# Altium schematic sheet EL.SchDoc: Electronic Load
size A4; ApprovedBy: LD Stanton; Author: LD Stanton; CompanyName: University of Cape Town; DrawnBy: Lawrence Stanton; Engineer: Lawrence Stanton; Organization: University of Cape Town; Address1: Department of Electrical Engineering; Address2: Rondebosch; Address3: Cape Town; Address4: South Africa 7701; DocumentNumber: 13; SheetNumber: 13; SheetTotal: 14
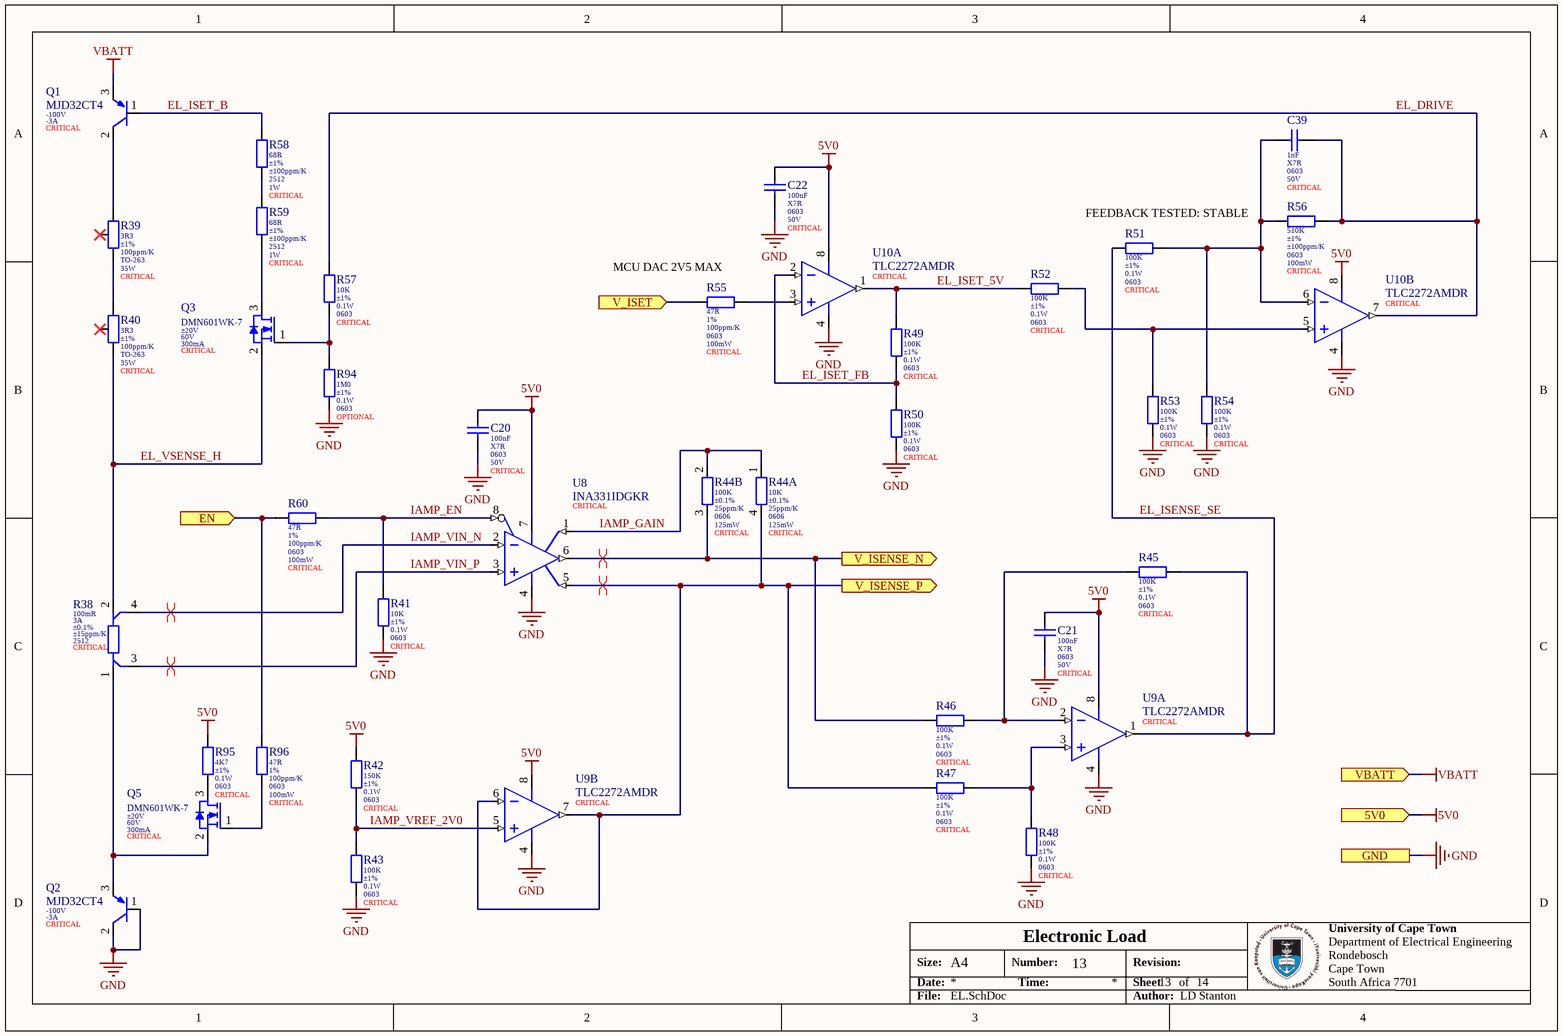
[diagram p0: EL.SchDoc]

## Parts
C20  value 100nF  Dielectric: X7R  Package: 0603  Voltage: 50V  Populate: CRITICAL  [0603 (Yageo DA) B]  (hidden comment: CC0603KRX7R9BB104)
C21  value 100nF  Dielectric: X7R  Package: 0603  Voltage: 50V  Populate: CRITICAL  [0603 (Yageo DA) B]  (hidden comment: CC0603KRX7R9BB104)
C22  value 100nF  Dielectric: X7R  Package: 0603  Voltage: 50V  Populate: CRITICAL  [0603 (Yageo DA) B]  (hidden comment: CC0603KRX7R9BB104)
C39  value 1nF  Dielectric: X7R  Package: 0603  Voltage: 50V  Populate: CRITICAL  [0603_080_8 (Samsung) B]  (hidden comment: CL10B102KB8NNNC)
Q1  MJD32CT4  Collector-Emitter Voltage: -100V  Collector Current: -3A  Placement: CRITICAL  [TO-252 (MJD32C) B]
Q2  MJD32CT4  Collector-Emitter Voltage: -100V  Collector Current: -3A  Placement: CRITICAL  [TO-252 (MJD32C) B]
Q3  DMN601WK-7  Gate Source Voltage: ±20V  Drain Source Voltage: 60V  Continous Drain Current: 300mA  Placement: CRITICAL  [SOT323 (DMN601WK) B]
Q5  DMN601WK-7  Gate Source Voltage: ±20V  Drain Source Voltage: 60V  Continous Drain Current: 300mA  Placement: CRITICAL  [SOT323 (DMN601WK) B]
R38  value 100mR  Current Rating: 3A  Tolerance: ±0.1%  Temperature Coefficient: ±15ppm/K  Package: 2512  Populate: CRITICAL  [2512 (Resi PCSR2512) MRG]  (hidden comment: PCSR2512BR100M6)
R39  value 3R3  Tolerance: ±1%  Temperature Coefficient: 100ppm/K  Package: TO-263  Power: 35W  Populate: CRITICAL  [TO-263 (TPAL0263) B]  (hidden comment: TPAL0263F3R30K9)
R40  value 3R3  Tolerance: ±1%  Temperature Coefficient: 100ppm/K  Package: TO-263  Power: 35W  Populate: CRITICAL  [TO-263 (TPAL0263) B]  (hidden comment: TPAL0263F3R30K9)
R41  value 10K  Tolerance: ±1%  Power: 0.1W  Package: 0603  Populate: CRITICAL  [0603 (Uniroyal) B]  (hidden comment: 0603WAF1002T5E)
R42  value 150K  Tolerance: ±1%  Power: 0.1W  Package: 0603  Populate: CRITICAL  [0603 (Uniroyal) B]  (hidden comment: 0603WAF1503T5E)
R43  value 100K  Tolerance: ±1%  Power: 0.1W  Package: 0603  Populate: CRITICAL  [0603 (Uniroyal) B]  (hidden comment: 0603WAF1003T5E)
R44  value 10K  Tolerance: ±0.1%  Temperature Coefficient: 25ppm/K  Package: 0606  Power: 125mW  Populate: CRITICAL  [0606 (Vishay ACASN) B]  (hidden comment: ACASN1002S1003P1AT)  (parts A,B of 2)
R45  value 100K  Tolerance: ±1%  Power: 0.1W  Package: 0603  Populate: CRITICAL  [0603 (Uniroyal) B]  (hidden comment: 0603WAF1003T5E)
R46  value 100K  Tolerance: ±1%  Power: 0.1W  Package: 0603  Populate: CRITICAL  [0603 (Uniroyal) B]  (hidden comment: 0603WAF1003T5E)
R47  value 100K  Tolerance: ±1%  Power: 0.1W  Package: 0603  Populate: CRITICAL  [0603 (Uniroyal) B]  (hidden comment: 0603WAF1003T5E)
R48  value 100K  Tolerance: ±1%  Power: 0.1W  Package: 0603  Populate: CRITICAL  [0603 (Uniroyal) B]  (hidden comment: 0603WAF1003T5E)
R49  value 100K  Tolerance: ±1%  Power: 0.1W  Package: 0603  Populate: CRITICAL  [0603 (Uniroyal) B]  (hidden comment: 0603WAF1003T5E)
R50  value 100K  Tolerance: ±1%  Power: 0.1W  Package: 0603  Populate: CRITICAL  [0603 (Uniroyal) B]  (hidden comment: 0603WAF1003T5E)
R51  value 100K  Tolerance: ±1%  Power: 0.1W  Package: 0603  Populate: CRITICAL  [0603 (Uniroyal) B]  (hidden comment: 0603WAF1003T5E)
R52  value 100K  Tolerance: ±1%  Power: 0.1W  Package: 0603  Populate: CRITICAL  [0603 (Uniroyal) B]  (hidden comment: 0603WAF1003T5E)
R53  value 100K  Tolerance: ±1%  Power: 0.1W  Package: 0603  Populate: CRITICAL  [0603 (Uniroyal) B]  (hidden comment: 0603WAF1003T5E)
R54  value 100K  Tolerance: ±1%  Power: 0.1W  Package: 0603  Populate: CRITICAL  [0603 (Uniroyal) B]  (hidden comment: 0603WAF1003T5E)
R55  value 47R  Tolerance: 1%  Temperature Coefficient: 100ppm/K  Package: 0603  Power: 100mW  Populate: CRITICAL  [0603 (Uniroyal) B]  (hidden comment: 0603WAF470JT5E)
R56  value 510K  Tolerance: ±1%  Temperature Coefficient: ±100ppm/K  Package: 0603  Power: 100mW  Populate: CRITICAL  [0603 (Uniroyal) B]  (hidden comment: 0603WAF5103T5E)
R57  value 10K  Tolerance: ±1%  Power: 0.1W  Package: 0603  Populate: CRITICAL  [0603 (Uniroyal) B]  (hidden comment: 0603WAF1002T5E)
R58  value 68R  Tolerance: ±1%  Temperature Coefficient: ±100ppm/K  Package: 2512  Power: 1W  Populate: CRITICAL  [2512 (Uniroyal) B]  (hidden comment: 25121WF680JT4E)
R59  value 68R  Tolerance: ±1%  Temperature Coefficient: ±100ppm/K  Package: 2512  Power: 1W  Populate: CRITICAL  [2512 (Uniroyal) B]  (hidden comment: 25121WF680JT4E)
R60  value 47R  Tolerance: 1%  Temperature Coefficient: 100ppm/K  Package: 0603  Power: 100mW  Populate: CRITICAL  [0603 (Uniroyal) B]  (hidden comment: 0603WAF470JT5E)
R94  value 1M0  Tolerance: ±1%  Power: 0.1W  Package: 0603  Populate: OPTIONAL  [0603 (Uniroyal) B]  (hidden comment: 0603WAF1004T5E)
R95  value 4K7  Tolerance: ±1%  Power: 0.1W  Package: 0603  Populate: CRITICAL  [0603 (Uniroyal) B]  (hidden comment: 0603WAF4701T5E)
R96  value 47R  Tolerance: 1%  Temperature Coefficient: 100ppm/K  Package: 0603  Power: 100mW  Populate: CRITICAL  [0603 (Uniroyal) B]  (hidden comment: 0603WAF470JT5E)
U8  INA331IDGKR  Placement: CRITICAL  [MSOP-8 (INA331) B]
U9  TLC2272AMDR  Placement: CRITICAL  [SOIC-8 (D008A) B]  (parts A,B of 2)
U10  TLC2272AMDR  Placement: CRITICAL  [SOIC-8 (D008A) B]  (parts A,B of 2)

## Ports
5V0 (in), EN (in), GND, V_ISENSE_N (out), V_ISENSE_P (out), V_ISET (in), VBATT (in)

## Nets
5V0: C20.1 C21.1 C22.1 R42.1 R95.1 U8.7(V+) U9.8(VDD+) U10.8(VDD+) ; port 5V0
GND: C20.2 C21.2 C22.2 Q2.1(B) Q2.2(C) R41.2 R43.2 R48.1 R50.1 R53.1 R54.1 R94.2 U8.4(V-) U9.4(VDD-/GND) U10.4(VDD-/GND) ; port GND
VBATT: Q1.3(E) ; port VBATT
EL_DRIVE: C39.2 R56.2 R57.1 U10.7(OUT2)
EL_ISENSE_SE: R45.2 R51.2 U9.1(OUT1)
EL_ISET_5V: R49.2 R52.2 U10.1(OUT1)
EL_ISET_B: Q1.1(B) R58.1
EL_ISET_FB: R49.1 R50.2 U10.2(IN1-)
EL_VSENSE_H: Q3.2(S) R38.2 R40.1
EN: R60.1 R96.2 ; port EN
IAMP_EN: R41.1 R60.2 U8.8(~{SHUTDOWN})
IAMP_GAIN: R44.1 R44.2 U8.1(RG)
IAMP_VIN_N: R38.4 U8.2(VIN-)
IAMP_VIN_P: R38.3 U8.3(VIN+)
IAMP_VREF_2V0: R42.2 R43.1 U9.5(IN2+)
V_ISENSE_N: R44.3 R46.1 U8.6(VOUT) ; port V_ISENSE_N
V_ISENSE_P: R44.4 R47.1 U8.5(REF) U9.6(IN2-) U9.7(OUT2) ; port V_ISENSE_P
V_ISET: R55.1 ; port V_ISET
NetC39_1: C39.1 R51.1 R54.2 R56.1 U10.6(IN2-)
NetQ1_2: Q1.2(C) R39.2
NetQ2_3: Q2.3(E) Q5.2(S) R38.1
NetQ3_1: Q3.1(G) R57.2 R94.1
NetQ3_3: Q3.3(D) R59.2
NetQ5_1: Q5.1(G) R96.1
NetQ5_3: Q5.3(D) R95.2
NetR39_1: R39.1 R40.2
NetR45_1: R45.1 R46.2 U9.2(IN1-)
NetR47_2: R47.2 R48.2 U9.3(IN1+)
NetR52_1: R52.1 R53.2 U10.5(IN2+)
NetR55_2: R55.2 U10.3(IN1+)
NetR58_2: R58.2 R59.1

Not connected (* = marked no-connect by the designer): R39 3*; R40 3*

## Layout directives
differential pair: IAMP_VIN_N, IAMP_VIN_P, V_ISENSE_N, V_ISENSE_P

## Notes on the sheet
- (near R51) FEEDBACK TESTED: STABLE
- (near R55) MCU DAC 2V5 MAX
- Labels drawn without touching a wire or pin: \
- Size:
- Date:
- A4
- Number:
- Time:
- Revision:
- Sheet
- of
- File:
- Author:

## Library data of the parts
C20-C22 = CMP-047-000000-9: MLCC 100nF 50V 0603 X7R ±10%; Manufacturer: Yageo; Tolerance: ±10%; ComponentLink1Description: Datasheet; ComponentLink1URL: https://datasheet.lcsc.com/szlcsc/YAGEO-CC0603KRX7R9BB104_C14663.pdf; LCSC Part Number: C14663
C39 = CMP-045-000000-10: MLCC 1nF 0603 50V X7R ±10%; Manufacturer: Samsung; ComponentLink1URL: https://datasheet.lcsc.com/szlcsc/Samsung-Electro-Mechanics-CL05C100JB5NNNC_C32949.pdf; Tolerance: ±10%; ComponentLink1Description: Datasheet; LCSC Part Number: C1588
Q1 Q2 = CMP-00132-1: Power Bipolar Transistor, 3A I(C), 100V V(BR)CEO, 1-Element, PNP, Silicon, Plastic/Epoxy, 2 Pin; pin to pad: 2>4; Base Current: -1A; Emitter-Base Voltage: -5V; ComponentLink1Description: Datasheet; ComponentLink1URL: https://mm.digikey.com/Volume0/opasdata/d220001/medias/docus/844/MJD32C_Rev4_Jun2012.pdf; Max Operating Temperature: 160°C; LCSC Part Number: C2905365; Min Operating Temperature: -65°C; Collector-Base Voltage: -100V
Q3 Q5 = CMP-00131-1: Mosfet, N-Ch, 60V, 0.3A, Sot-323 Rohs Compliant: Yes; Drain Source Resistance: 2; Polarity: N-Channel; Mode: Enhancement; LCSC Part Number: C151318; ComponentLink1URL: https://jlcpcb.com/api/file/downloadByFileSystemAccessId/8586203582969860096; Min Operating Temperature: -65°C; ComponentLink1Description: Datasheet; Max Operating Temperature: 150°C
R38 = CMP-009-00005-3: 100mΩ 1W Current Sense Resistor ±0.1% ±15ppm/K 2512; LCSC Part Number: C23067426; ComponentLink1URL: https://s.resistor.today/shop/products/epdf/PCSR2512.pdf; Composition: Wirewound; Power: 1W; Min Operating Temperature: -55°C; Max Operating Temperature: 170°C; ComponentLink1Description: Datasheet
R39 R40 = CMP-009-00007-1: 3.3Ω 35W 500V Planar Non-Inductive Power Resistor ±1% ±100ppm/℃ TO-263; ComponentLink1URL: https://s.resistor.today/shop/products/epdf/TPAL0263.pdf; Max Operating Temperature: 150°C; Min Operating Temperature: -55°C; ComponentLink1Description: Datasheet; LCSC Part Number: C22446548; Voltage Rating: 500V
R41 R57 = CMP-010-000293-9: Resistor 10K 0603 ±1% Thick Film Uniroyal; Working Voltage: 75V; Temperature Coefficient: ±100ppm/K; Temperature: -55 - 155°C; ComponentLink1URL: https://datasheet.lcsc.com/szlcsc/1811062009_UNI-ROYAL-Uniroyal-Elec-0603WAF1002T5E_C25804.pdf; LCSC Part Number: C25804; ComponentLink1Description: Datasheet; Pin Count: 2; Manufacturer: Uniroyal
R42 = CMP-010-000303-9: Resistor 150K 0603 ±1% Thick Film Uniroyal; Temperature Coefficient: ±100ppm/K; Working Voltage: 75V; Manufacturer: Uniroyal; ComponentLink1URL: https://datasheet.lcsc.com/szlcsc/1811062009_UNI-ROYAL-Uniroyal-Elec-0603WAF1002T5E_C25804.pdf; Temperature: -55 - 155°C; LCSC Part Number: C22807; ComponentLink1Description: Datasheet; Pin Count: 2
R43 R45-R54 = CMP-010-000288-10: Resistor 100K 0603 ±1% Thick Film Uniroyal; Temperature Coefficient: ±100ppm/K; Working Voltage: 75V; LCSC Part Number: C25803; Temperature: -55 - 155°C; ComponentLink1URL: https://datasheet.lcsc.com/szlcsc/1811062009_UNI-ROYAL-Uniroyal-Elec-0603WAF1002T5E_C25804.pdf; Pin Count: 2; Manufacturer: Uniroyal; ComponentLink1Description: Datasheet
R44 = CMP-009-00004-9: Resistor Array 100K,10K 0606 ±0.1% Thin Film Vishay; Voltage Rating: 100V; Min Operating Temperature: -55°C; LCSC Part Number: C6733329; Composition: Thin Film; ComponentLink1URL: https://www.vishay.com/docs/28770/acasat.pdf; Value 1: 10K; Value 2: 100K; ComponentLink1Description: Datasheet; Max Operating Temperature: 125°C
R55 R60 R96 = CMP-00128-3: Resistor 47R 0603 ±1% Thick Film Uniroyal; Voltage Rating: 75V; ComponentLink1Description: Datasheet; Min Operating Temperature: -55°C; Manufacturer: Uniroyal; ComponentLink1URL: https://datasheet.lcsc.com/szlcsc/1811062009_UNI-ROYAL-Uniroyal-Elec-0603WAF1002T5E_C25804.pdf; Composition: Thick Film; LCSC Part Number: C23182; Max Operating Temperature: 155°C
R56 = CMP-00137-1: Resistor 510K 0603 ±1% Thick Film Uniroyal; Voltage Rating: 75V; Min Operating Temperature: -55°C; ComponentLink1Description: Datasheet; Manufacturer: Uniroyal; LCSC Part Number: C23192; ComponentLink1URL: https://datasheet.lcsc.com/szlcsc/1811062009_UNI-ROYAL-Uniroyal-Elec-0603WAF1002T5E_C25804.pdf; Max Operating Temperature: 155°C; Composition: Thick Film
R58 R59 = CMP-00133-1: Resistor 68R 2512 ±1% 1W Thick Film Uniroyal; Voltage Rating: 200V; ComponentLink1URL: https://datasheet.lcsc.com/lcsc/1810301111_UNI-ROYAL-Uniroyal-Elec-25121WF100MT4E_C127692.pdf; ComponentLink1Description: Datasheet; Max Operating Temperature: 155°C; Temperature: -55 - 155°C; Min Operating Temperature: -55°C; Composition: Thick Film; LCSC Part Number: C50371
R94 = CMP-010-000313-12: Resistor 1M0 0603 ±1% Thick Film Uniroyal; Working Voltage: 75V; Temperature Coefficient: ±100ppm/K; Temperature: -55 - 155°C; Pin Count: 2; Manufacturer: Uniroyal; LCSC Part Number: C22935; ComponentLink1Description: Datasheet; ComponentLink1URL: https://datasheet.lcsc.com/szlcsc/1811062009_UNI-ROYAL-Uniroyal-Elec-0603WAF1002T5E_C25804.pdf
R95 = CMP-010-000405-2: Resistor 4K7 0603 ±1% Thick Film Uniroyal; Temperature Coefficient: ±100ppm/K; Working Voltage: 75V; Manufacturer: Uniroyal; ComponentLink1Description: Datasheet; Temperature: -55 - 155°C; ComponentLink1URL: https://datasheet.lcsc.com/szlcsc/1811062009_UNI-ROYAL-Uniroyal-Elec-0603WAF1002T5E_C25804.pdf; LCSC Part Number: C23162
U8 = CMP-014-00000-1: Low-Power, Single Supply, CMOS, Instrumentation Amplifier 8-VSSOP -55 to 125; Output Current: 48mA; Output Type: Push-Pull; Max Supply Voltage: 5.5V; Min Supply Voltage: 2.5V; Min Operating Temperature: -55°C; Max Operating Temperature: 125°C; ComponentLink1Description: Datasheet; ComponentLink1URL: https://www.ti.com/lit/ds/symlink/ina331.pdf?ts=1756763479272&ref_url=https%253A%252F%252Fwww.google.com%252F; LCSC Part Number: C2863664
U9 U10 = CMP-00126-1: Operational Amplifier, 2 Func, 1500uV Offset-Max, CMOS, PDSO8; Single Supply: Yes; Output Current: 50mA; Input Bias Current: 800pA; Input Offset Voltage: 1.5mV; Supply Max: 8V; Supply Min: -8V; Rail to Rail: Yes; ComponentLink1Description: Datasheet; Input Offset Current: 800pA; LCSC Part Number: C2878284; Min Operating Temperature: -55°C; Max Operating Temperature: 125°C; ComponentLink1URL: https://www.ti.com/lit/ds/symlink/tlc2272.pdf?ts=1754033641708&ref_url=https%253A%252F%252Fwww.ti.com%252Fproduct%252FTLC2272%253Futm_source%253Dgoogle%2526utm_medium%253Dcpc%2526utm_campaign%253Dasc-amps-null-44700045336317476_prodfolderdynamic-cpc-pf-go